# EAGLE schematic Airband (EAGLE 8.6.3)

## Sheet 1 of 7
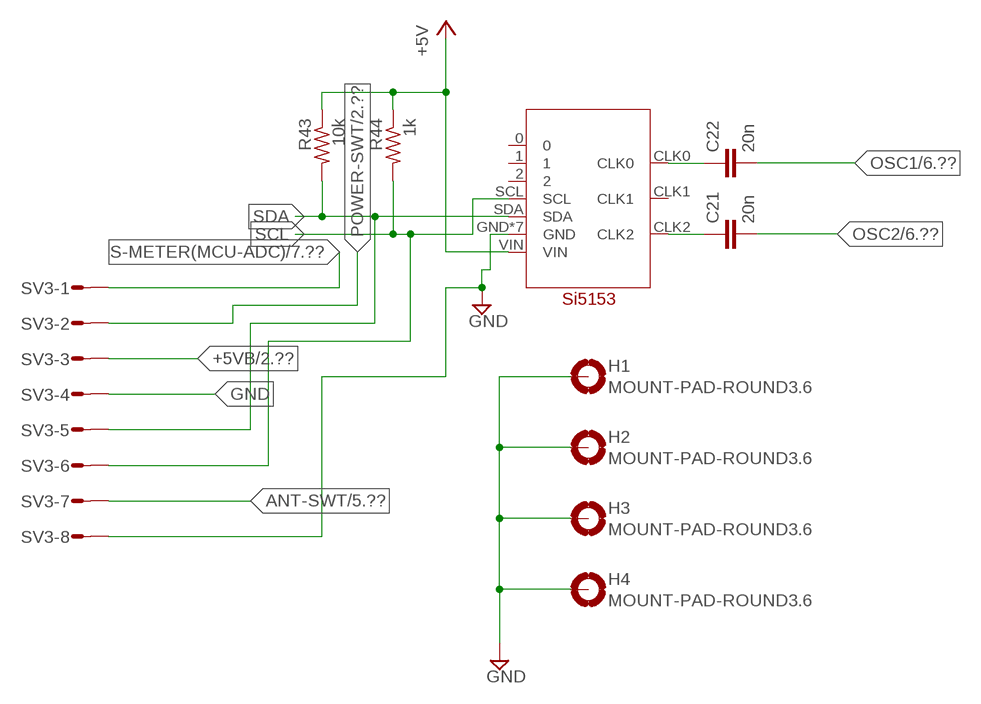
[diagram p0: schematic, sheet 1]

### Parts
C21  20n  C-EUC0805  [C0805]
C22  20n  C-EUC0805  [C0805]
H1  MOUNT-PAD-ROUND3.6  [3,6-PAD]
H2  MOUNT-PAD-ROUND3.6  [3,6-PAD]
H3  MOUNT-PAD-ROUND3.6  [3,6-PAD]
H4  MOUNT-PAD-ROUND3.6  [3,6-PAD]
R43  10k  R-US_R0805  [R0805]
R44  1k  R-US_R0805  [R0805]
SV3  MT6-8  [MT6-8]
U$10  DEVELOPMENT-BOARDS$1_SI5153SI5153  [DEVELOPMENT-BOARDS$1_SI5153]

### Nets
+5VA: R43.1 R44.1 U$10.VIN ; supply symbol labelled +5V ; also sheet 2
+5VB: SV3.3 ; also sheet 2
ANT-SWT: SV3.7 ; also sheet 5
GND: H1.B3,6(MOUNT) H2.B3,6(MOUNT) H3.B3,6(MOUNT) H4.B3,6(MOUNT) SV3.4 SV3.8 U$10.GND U$10.GND00(GND) U$10.GND0(GND) U$10.GND1(GND) U$10.GND2(GND) U$10.GND11(GND) U$10.GND22(GND) ; also sheet 2,3,4,5,6,7
N$38: C21.1 U$10.CLK2
N$39: C22.1 U$10.CLK0
OSC1: C22.2 ; also sheet 6
OSC2: C21.2 ; also sheet 6
POWER-SWT: SV3.2 ; also sheet 2
S-METER(MCU-ADC): SV3.1 ; also sheet 7
SCL: R44.2 SV3.6 U$10.SCL
SDA: R43.2 SV3.5 U$10.SDA
Unconnected: U$10.0 U$10.1 U$10.2 U$10.CLK1

## Sheet 2 of 7
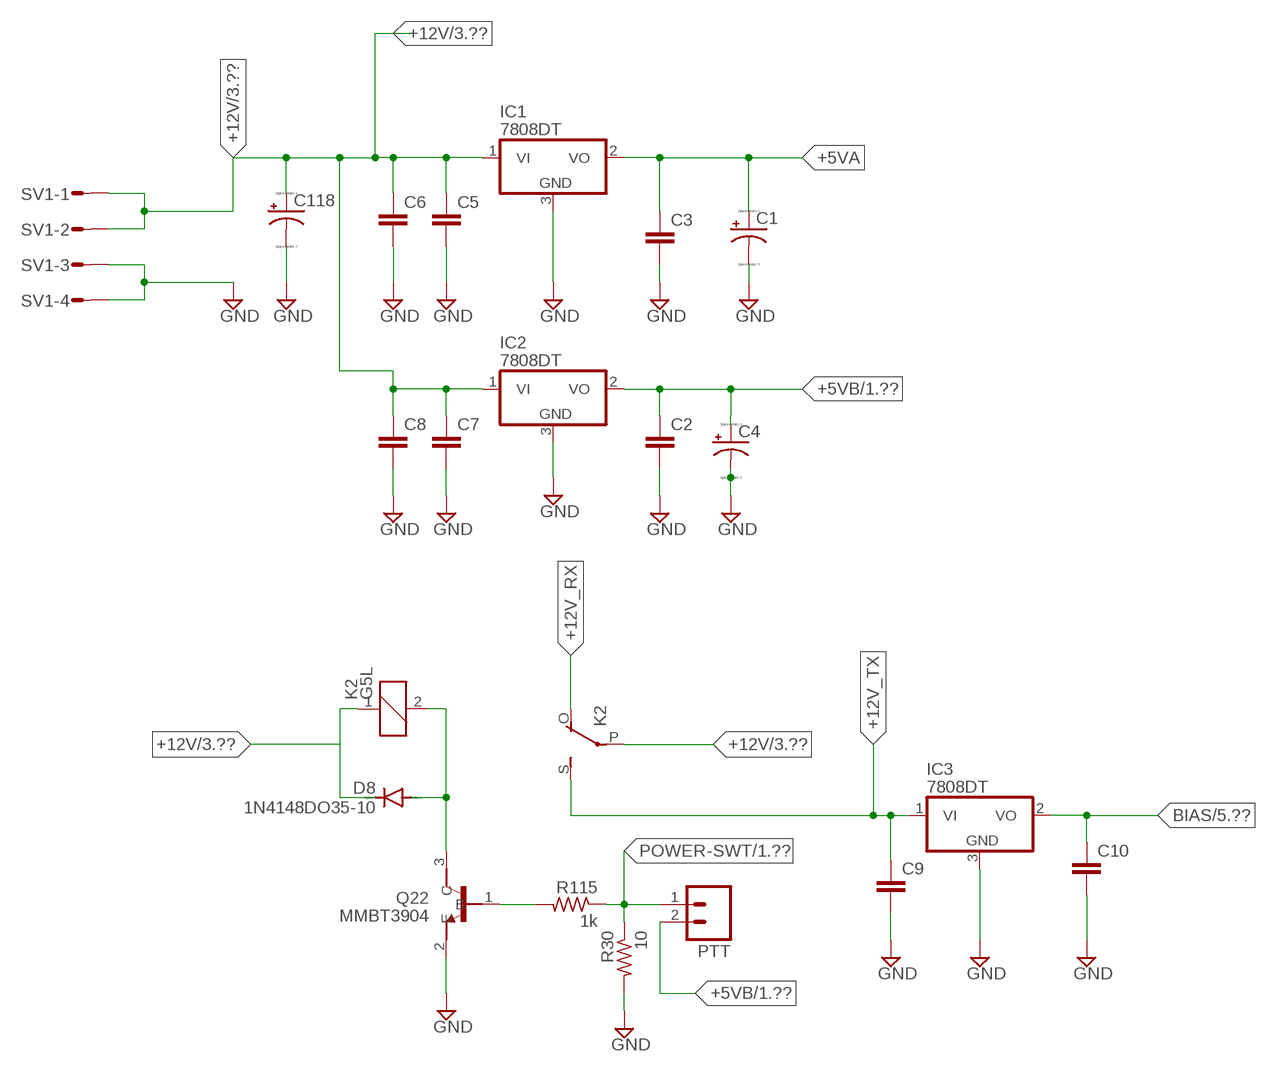
[diagram p1: schematic, sheet 2]

### Parts
C1  CPOL-US153CLV-0405  [153CLV-0405]
C2  C-EUC0805  [C0805]
C3  C-EUC0805  [C0805]
C4  CPOL-US153CLV-0405  [153CLV-0405]
C5  C-EUC0805  [C0805]
C6  C-EUC0805  [C0805]
C7  C-EUC0805  [C0805]
C8  C-EUC0805  [C0805]
C9  C-EUC0805  [C0805]
C10  C-EUC0805  [C0805]
C118  CPOL-US153CLV-0405  [153CLV-0405]
D8  1N4148DO35-10  [DO35-7SMD]
IC1  7808DT  [TO252]
IC2  7808DT  [TO252]
IC3  7808DT  [TO252]
K2  G5L  [G5LE]
PTT  M02  [02P]
Q22  MMBT3904  [SOT95P240X120-3N]
R30  10  R-US_R0805  [R0805]
R115  1k  R-US_R0805  [R0805]
SV1  MT6-4Y  [MT6-4Y]

### Nets
+5VA: C1.+ C3.1 IC1.2(VO) ; also sheet 1
+5VB: C2.1 C4.+ IC2.2(VO) PTT.2 ; also sheet 1
+12V: C5.1 C6.1 C7.1 C8.1 C118.+ D8.C IC1.1(VI) IC2.1(VI) K2.1 K2.P(2:P) SV1.1 SV1.2 ; also sheet 3,5
+12V_RX: K2.O(2:O)
+12V_TX: C9.1 IC3.1(VI) K2.S(2:S)
BIAS: C10.1 IC3.2(VO) ; also sheet 5
GND: C1.- C2.2 C3.2 C4.- C5.2 C6.2 C7.2 C8.2 C9.2 C10.2 C118.- IC1.3(GND) IC2.3(GND) IC3.3(GND) Q22.2(E) R30.2 SV1.3 SV1.4 ; also sheet 1,3,4,5,6,7
N$161: D8.A K2.2 Q22.3(C)
N$162: Q22.1(B) R115.2
POWER-SWT: PTT.1 R30.1 R115.1 ; also sheet 1

## Sheet 3 of 7
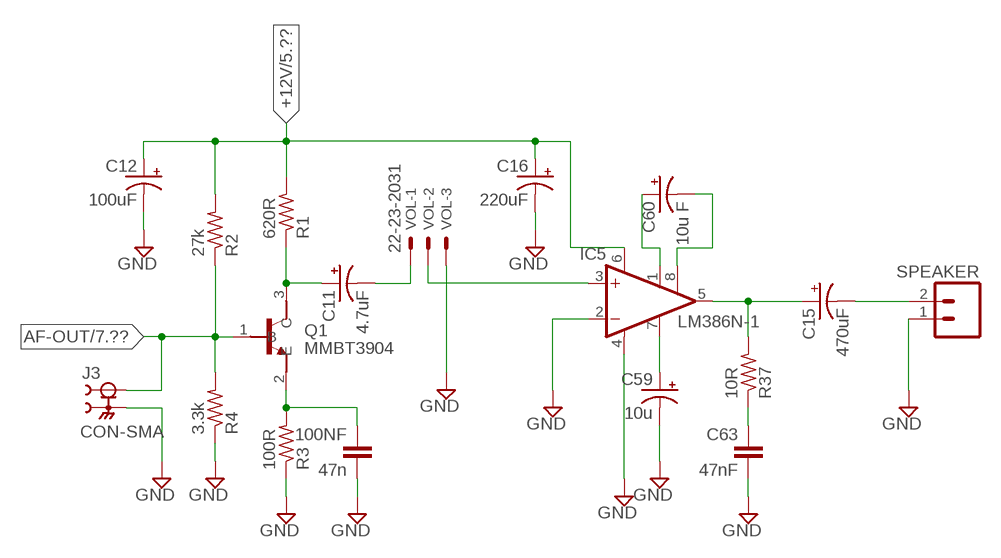
[diagram p2: schematic, sheet 3]

### Parts
100NF  47n  C-EUC0805  [C0805]
C11  4.7uF  CPOL-US153CLV-0405  [153CLV-0405]
C12  100uF  CPOL-US153CLV-0405  [153CLV-0405]
C15  470uF  CPOL-US153CLV-0405  [153CLV-0405]
C16  220uF  CPOL-US153CLV-0405  [153CLV-0405]
C59  10u  CPOL-US153CLV-0405  [153CLV-0405]
C60  10u F  CPOL-US153CLV-0405  [153CLV-0405]
C63  47nF  C-EUC0805  [C0805]
IC5  LM386N-1  [DIL08]
J3  CON-SMA  [CON-SMA-MINI]
Q1  MMBT3904  [SOT95P240X120-3N]
R1  620R  R-US_R0805  [R0805]
R2  27k  R-US_R0805  [R0805]
R3  100R  R-US_R0805  [R0805]
R4  3.3k  R-US_R0805  [R0805]
R37  10R  R-US_R0805  [R0805]
SPEAKER  M02  [02P]
VOL  22-23-2031  [22-23-2031]

### Nets
+12V: C12.+ C16.+ IC5.6(VS) R1.2 R2.2 ; also sheet 2,5
AF-OUT: J3.1 Q1.1(B) R2.1 R4.2 ; also sheet 7
GND: 100NF.2 C12.- C16.- C59.- C63.2 IC5.2(-IN) IC5.4(GND) J3.S1 J3.S2 J3.S3 J3.S4 R3.1 R4.1 SPEAKER.1 VOL.3 ; also sheet 1,2,4,5,6,7
N$1: 100NF.1 Q1.2(E) R3.2
N$6: C11.+ Q1.3(C) R1.1
N$7: C11.- VOL.1
N$8: IC5.3(+IN) VOL.2
N$10: C15.+ IC5.5(OUT) R37.2
N$11: C15.- SPEAKER.2
N$12: C59.+ IC5.7(BYPASS)
N$13: C63.1 R37.1
N$14: C60.+ IC5.1(GAIN)
N$15: C60.- IC5.8(GAIN)

## Sheet 4 of 7
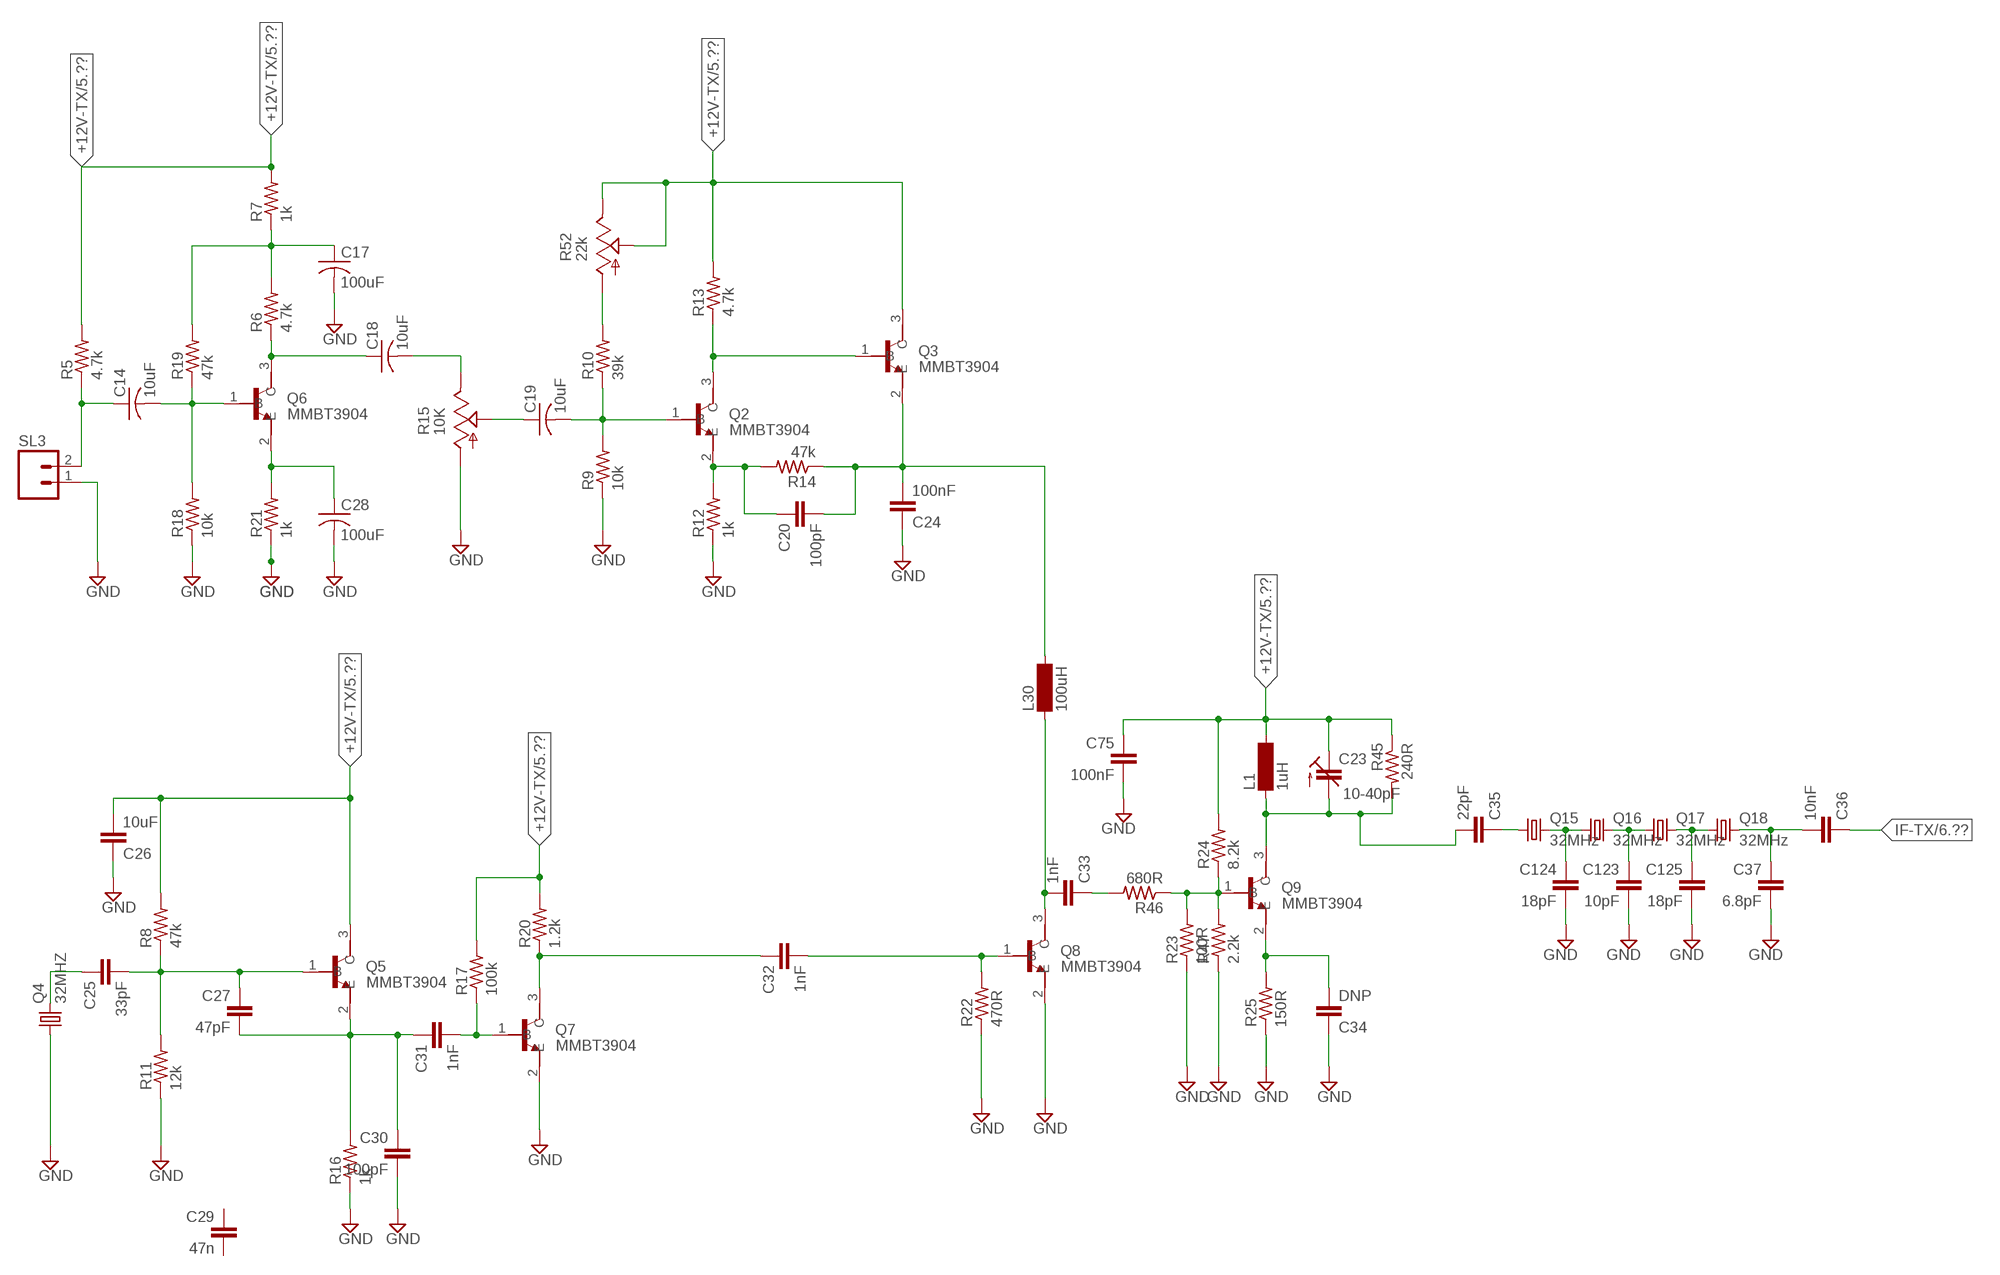
[diagram p3: schematic, sheet 4]

### Parts
C14  10uF  C-USC0805K  [C0805K]
C17  100uF  C-USC0805K  [C0805K]
C18  10uF  C-USC0805K  [C0805K]
C19  10uF  C-USC0805K  [C0805K]
C20  100pF  C-EUC0805  [C0805]
C23  10-40pF  C-TRIMM3008  [CTRIM3008]
C24  100nF  C-EUC0805  [C0805]
C25  33pF  C-EUC0805  [C0805]
C26  10uF  C-EUC0805  [C0805]
C27  47pF  C-EUC0805  [C0805]
C28  100uF  C-USC0805K  [C0805K]
C29  47n  C-EUC0805  [C0805]
C30  100pF  C-EUC0805  [C0805]
C31  1nF  C-EUC0805  [C0805]
C32  1nF  C-EUC0805  [C0805]
C33  1nF  C-EUC0805  [C0805]
C34  DNP  C-EUC0805  [C0805]
C35  22pF  C-EUC0805  [C0805]
C36  10nF  C-EUC0805  [C0805]
C37  6.8pF  C-EUC0805  [C0805]
C75  100nF  C-EUC0805  [C0805]
C123  10pF  C-EUC0805  [C0805]
C124  18pF  C-EUC0805  [C0805]
C125  18pF  C-EUC0805  [C0805]
L1  1uH  SM-Z15  [SM-Z15]
L30  100uH  SM-Z15  [SM-Z15]
Q2  MMBT3904  [SOT95P240X120-3N]
Q3  MMBT3904  [SOT95P240X120-3N]
Q4  32MHZ  CRYSTALHC49S  [HC49/S]
Q5  MMBT3904  [SOT95P240X120-3N]
Q6  MMBT3904  [SOT95P240X120-3N]
Q7  MMBT3904  [SOT95P240X120-3N]
Q8  MMBT3904  [SOT95P240X120-3N]
Q9  MMBT3904  [SOT95P240X120-3N]
Q15  32MHz  CRYSTALHC49S  [HC49/S]
Q16  32MHz  CRYSTALHC49S  [HC49/S]
Q17  32MHz  CRYSTALHC49S  [HC49/S]
Q18  32MHz  CRYSTALHC49S  [HC49/S]
R5  4.7k  R-US_R0805  [R0805]
R6  4.7k  R-US_R0805  [R0805]
R7  1k  R-US_R0805  [R0805]
R8  47k  R-US_R0805  [R0805]
R9  10k  R-US_R0805  [R0805]
R10  39k  R-US_R0805  [R0805]
R11  12k  R-US_R0805  [R0805]
R12  1k  R-US_R0805  [R0805]
R13  4.7k  R-US_R0805  [R0805]
R14  47k  R-US_R0805  [R0805]
R15  10K  TRIM_US-B64Y  [B64Y]
R16  1k  R-US_R0805  [R0805]
R17  100k  R-US_R0805  [R0805]
R18  10k  R-US_R0805  [R0805]
R19  47k  R-US_R0805  [R0805]
R20  1.2k  R-US_R0805  [R0805]
R21  1k  R-US_R0805  [R0805]
R22  470R  R-US_R0805  [R0805]
R23  100R  R-US_R0805  [R0805]
R24  8.2k  R-US_R0805  [R0805]
R25  150R  R-US_R0805  [R0805]
R45  240R  R-US_R0805  [R0805]
R46  680R  R-US_R0805  [R0805]
R47  2.2k  R-US_R0805  [R0805]
R52  22k  TRIM_US-B64Y  [B64Y]
SL3  M02  [02P]

### Nets
+12V-TX: C23.+(E) C26.2 C75.1 L1.2 Q3.3(C) Q5.3(C) R5.2 R7.2 R8.2 R13.2 R17.2 R20.2 R24.2 R45.1 R52.E R52.S ; also sheet 5,6
GND: C17.2 C24.1 C26.1 C28.2 C30.2 C34.1 C37.2 C75.2 C123.2 C124.2 C125.2 Q4.1 Q7.2(E) Q8.2(E) R9.1 R11.1 R12.1 R15.A R16.1 R18.1 R21.1 R22.1 R23.1 R25.1 R47.1 SL3.1 ; also sheet 1,2,3,5,6,7
IF-TX: C36.1 ; also sheet 6
N$2: C23.-(A) C35.2 L1.1 Q9.3(C) R45.2
N$3: C14.1 R5.1 SL3.2
N$4: C17.1 R6.2 R7.1 R19.2
N$5: C18.1 Q6.3(C) R6.1
N$16: C14.2 Q6.1(B) R18.2 R19.1
N$17: C20.1 Q2.2(E) R12.2 R14.2
N$18: C28.1 Q6.2(E) R21.2
N$19: C19.2 Q2.1(B) R9.2 R10.1
N$20: Q2.3(C) Q3.1(B) R13.1
N$21: C20.2 C24.2 L30.2 Q3.2(E) R14.1
N$22: R10.2 R52.A
N$23: C33.1 R46.2
N$24: C35.1 Q15.1
N$25: C25.2 C27.1 Q5.1(B) R8.1 R11.2
N$26: C19.1 R15.S
N$27: C18.2 R15.E
N$28: C32.2 Q8.1(B) R22.2
N$30: C27.2 C30.1 C31.1 Q5.2(E) R16.2
N$31: C25.1 Q4.2
N$32: C31.2 Q7.1(B) R17.1
N$41: C32.1 Q7.3(C) R20.1
N$43: C33.2 L30.1 Q8.3(C)
N$44: Q9.1(B) R23.2 R24.1 R46.1 R47.2
N$45: C34.2 Q9.2(E) R25.2
N$48: C36.2 C37.1 Q18.2
N$141: C124.1 Q15.2 Q16.1
N$146: C123.1 Q16.2 Q17.1
N$147: C125.1 Q17.2 Q18.1
Unconnected: C29.1 C29.2

## Sheet 5 of 7
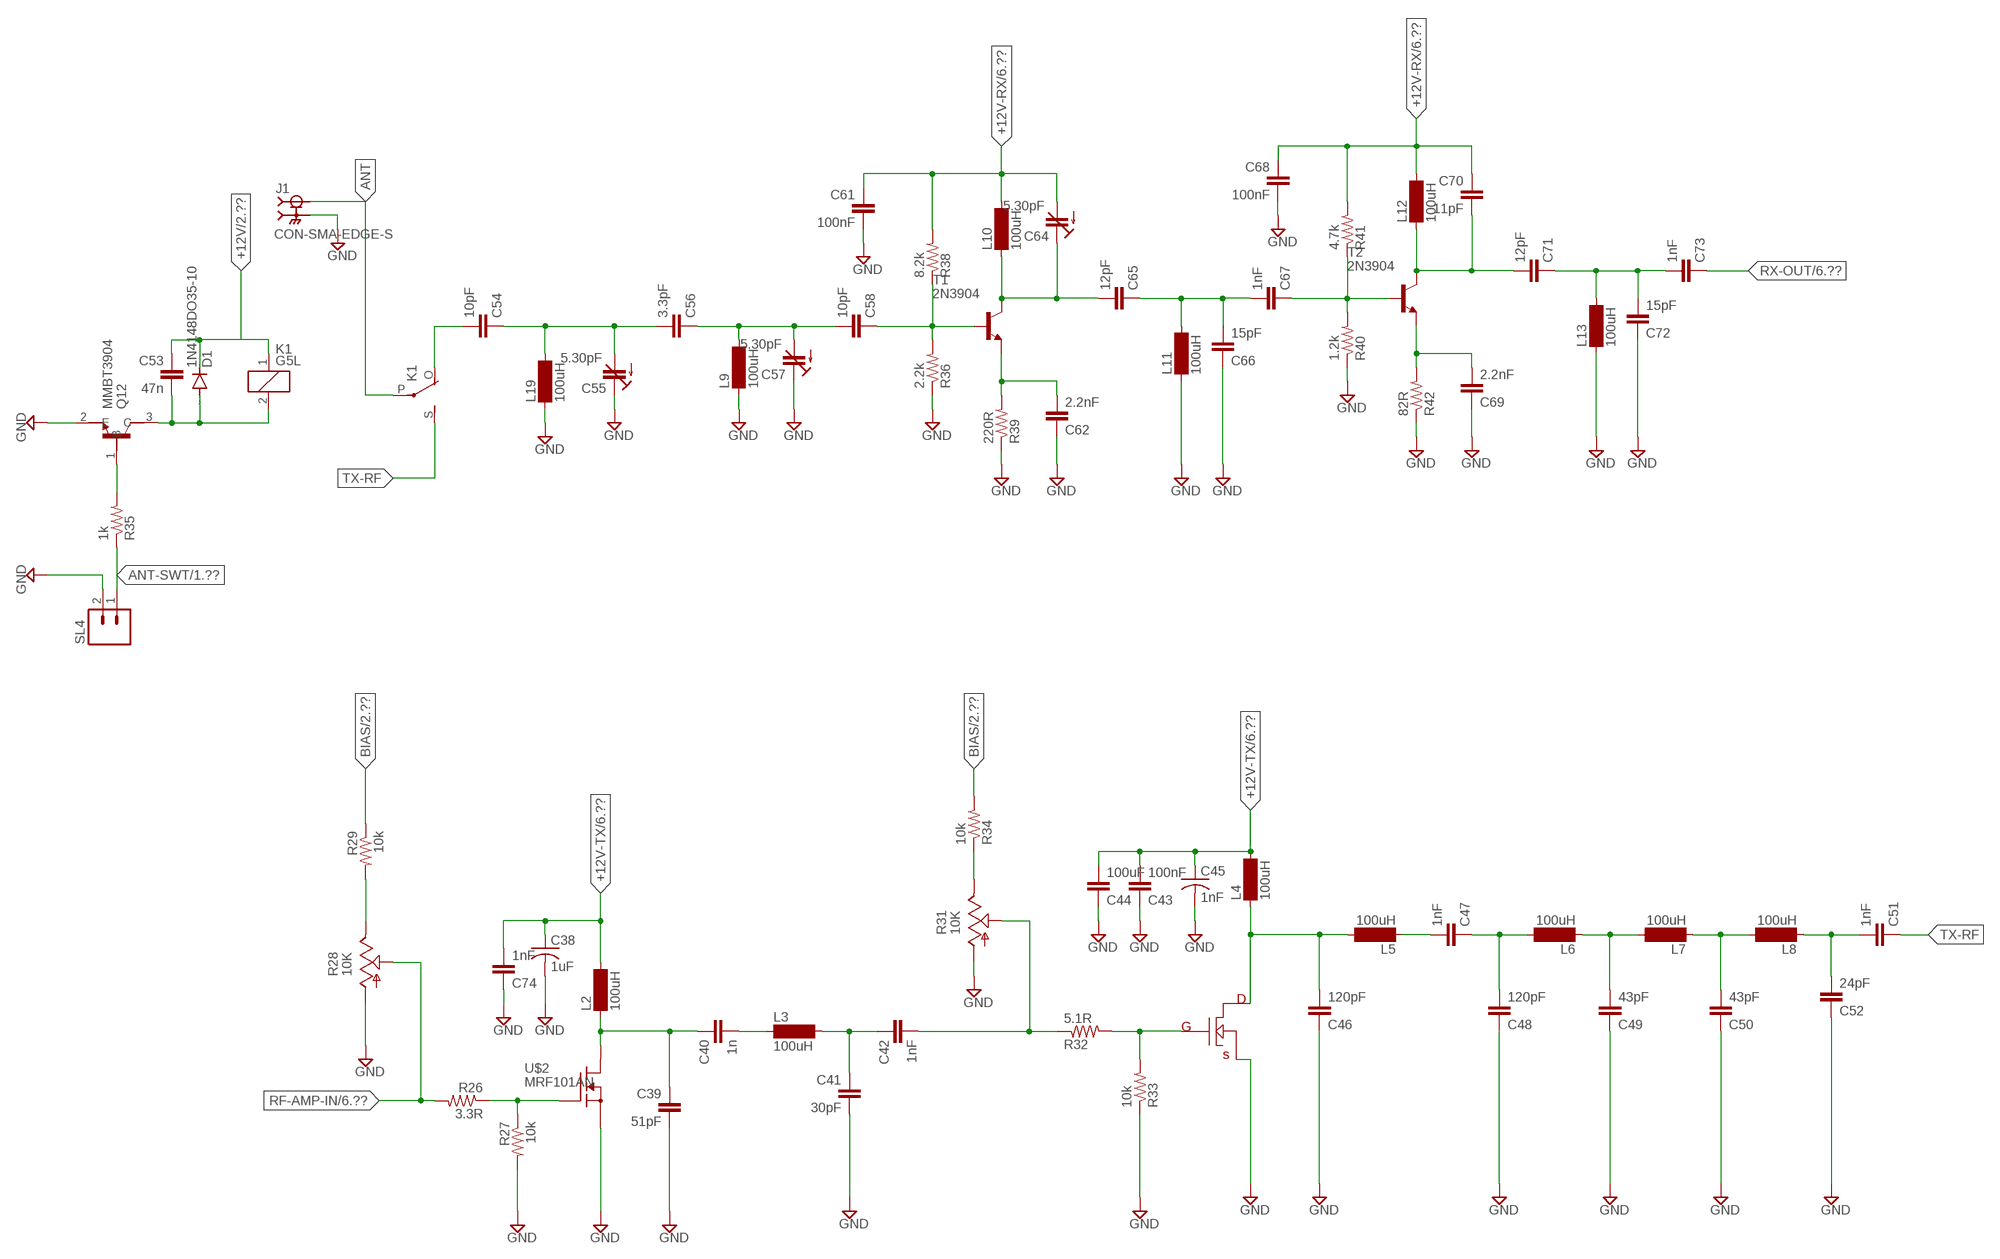
[diagram p4: schematic, sheet 5]

### Parts
C38  1uF  C-USC0805K  [C0805K]
C39  51pF  C-EUC0805  [C0805]
C40  1n  C-EUC0805  [C0805]
C41  30pF  C-EUC0805  [C0805]
C42  1nF  C-EUC0805  [C0805]
C43  100nF  C-EUC0805  [C0805]
C44  100uF  C-EUC0805  [C0805]
C45  1nF  C-USC0805K  [C0805K]
C46  120pF  C-EUC0805  [C0805]
C47  1nF  C-EUC0805  [C0805]
C48  120pF  C-EUC0805  [C0805]
C49  43pF  C-EUC0805  [C0805]
C50  43pF  C-EUC0805  [C0805]
C51  1nF  C-EUC0805  [C0805]
C52  24pF  C-EUC0805  [C0805]
C53  47n  C-EUC0805  [C0805]
C54  10pF  C-EUC0805  [C0805]
C55  5.30pF  C-TRIMM3008  [CTRIM3008]
C56  3.3pF  C-EUC0805  [C0805]
C57  5.30pF  C-TRIMM3008  [CTRIM3008]
C58  10pF  C-EUC0805  [C0805]
C61  100nF  C-EUC0805  [C0805]
C62  2.2nF  C-EUC0805  [C0805]
C64  5.30pF  C-TRIMM3008  [CTRIM3008]
C65  12pF  C-EUC0805  [C0805]
C66  15pF  C-EUC0805  [C0805]
C67  1nF  C-EUC0805  [C0805]
C68  100nF  C-EUC0805  [C0805]
C69  2.2nF  C-EUC0805  [C0805]
C70  11pF  C-EUC0805  [C0805]
C71  12pF  C-EUC0805  [C0805]
C72  15pF  C-EUC0805  [C0805]
C73  1nF  C-EUC0805  [C0805]
C74  1nF  C-EUC0805  [C0805]
D1  1N4148DO35-10  [DO35-7SMD]
J1  CON-SMA-EDGE-S  [RFSOLUTIONS_CON-SMA-EDGE-S]
K1  G5L  [G5LE]
L2  100uH  SM-Z15  [SM-Z15]
L3  100uH  SM-Z15  [SM-Z15]
L4  100uH  SM-Z15  [SM-Z15]
L5  100uH  SM-Z15  [SM-Z15]
L6  100uH  SM-Z15  [SM-Z15]
L7  100uH  SM-Z15  [SM-Z15]
L8  100uH  SM-Z15  [SM-Z15]
L9  100uH  SM-Z15  [SM-Z15]
L10  100uH  SM-Z15  [SM-Z15]
L11  100uH  SM-Z15  [SM-Z15]
L12  100uH  SM-Z15  [SM-Z15]
L13  100uH  SM-Z15  [SM-Z15]
L19  100uH  SM-Z15  [SM-Z15]
Q12  MMBT3904  [SOT95P240X120-3N]
R26  3.3R  R-US_R0805  [R0805]
R27  10k  R-US_R0805  [R0805]
R28  10K  TRIM_US-B64Y  [B64Y]
R29  10k  R-US_R0805  [R0805]
R31  10K  TRIM_US-B64Y  [B64Y]
R32  5.1R  R-US_R0805  [R0805]
R33  10k  R-US_R0805  [R0805]
R34  10k  R-US_R0805  [R0805]
R35  1k  R-US_R0805  [R0805]
R36  2.2k  R-US_R0805  [R0805]
R38  8.2k  R-US_R0805  [R0805]
R39  220R  R-US_R0805  [R0805]
R40  1.2k  R-US_R0805  [R0805]
R41  4.7k  R-US_R0805  [R0805]
R42  82R  R-US_R0805  [R0805]
SL4  M02  [02P]
T1  2N3904  [TO92-EBC(SMD)]
T2  2N3904  [TO92-EBC(SMD)]
U$1  RD04HMS2  [RD07MUS2B]
U$2  MRF101AN  [TO220]

### Nets
+12V: C53.1 D1.C K1.1 ; also sheet 2,3
+12V-RX: C61.1 C64.-(A) C68.1 C70.1 L10.2 L12.2 R38.2 R41.2 ; also sheet 6,7
+12V-TX: C38.1 C43.2 C44.2 C45.1 C74.2 L2.2 L4.2 ; also sheet 4,6
ANT: J1.1 K1.P(2:P)
ANT-SWT: R35.1 SL4.1 ; also sheet 1
BIAS: R29.1 R34.2 ; also sheet 2
GND: C38.2 C39.2 C41.2 C43.1 C44.1 C45.2 C46.1 C48.1 C49.1 C50.1 C52.1 C55.+(E) C57.+(E) C61.2 C62.1 C66.1 C68.2 C69.1 C72.1 C74.1 J1.G1 J1.G2 J1.G3 J1.G4 L9.1 L11.1 L13.1 L19.1 Q12.2(E) R27.2 R28.A R31.A R33.1 R36.1 R39.1 R40.1 R42.1 SL4.2 U$1.S U$2.2(S) ; also sheet 1,2,3,4,6,7
N$9: R28.E R29.2
N$33: R26.1 R27.1 U$2.1(G)
N$35: C39.1 C40.1 L2.1 U$2.3(D)
N$46: C53.2 D1.A K1.2 Q12.3(C)
N$47: C40.2 L3.1
N$50: C41.1 C42.1 L3.2
N$51: C42.2 R31.S R32.1
N$52: R32.2 R33.2 U$1.G
N$53: C46.2 L4.1 L5.2 U$1.D
N$54: Q12.1(B) R35.2
N$55: R31.E R34.1
N$57: C54.2 K1.O(2:O)
N$58: C47.2 L5.1
N$59: C47.1 C48.2 L6.2
N$60: C49.2 L6.1 L7.2
N$61: C50.2 L7.1 L8.2
N$62: C51.2 C52.2 L8.1
N$64: C54.1 C55.-(A) C56.2 L19.2
N$65: C56.1 C57.-(A) C58.2 L9.2
N$66: C58.1 R36.2 R38.1 T1.B
N$67: C62.2 R39.2 T1.E
N$68: C64.+(E) C65.2 L10.1 T1.C
N$69: C67.1 R40.2 R41.1 T2.B
N$70: C65.1 C66.2 C67.2 L11.2
N$71: C69.2 R42.2 T2.E
N$72: C70.2 C71.2 L12.1 T2.C
N$73: C71.1 C72.2 C73.2 L13.2
RF-AMP-IN: R26.2 R28.S ; also sheet 6
RX-OUT: C73.1 ; also sheet 6
TX-RF: C51.1 K1.S(2:S)

## Sheet 6 of 7
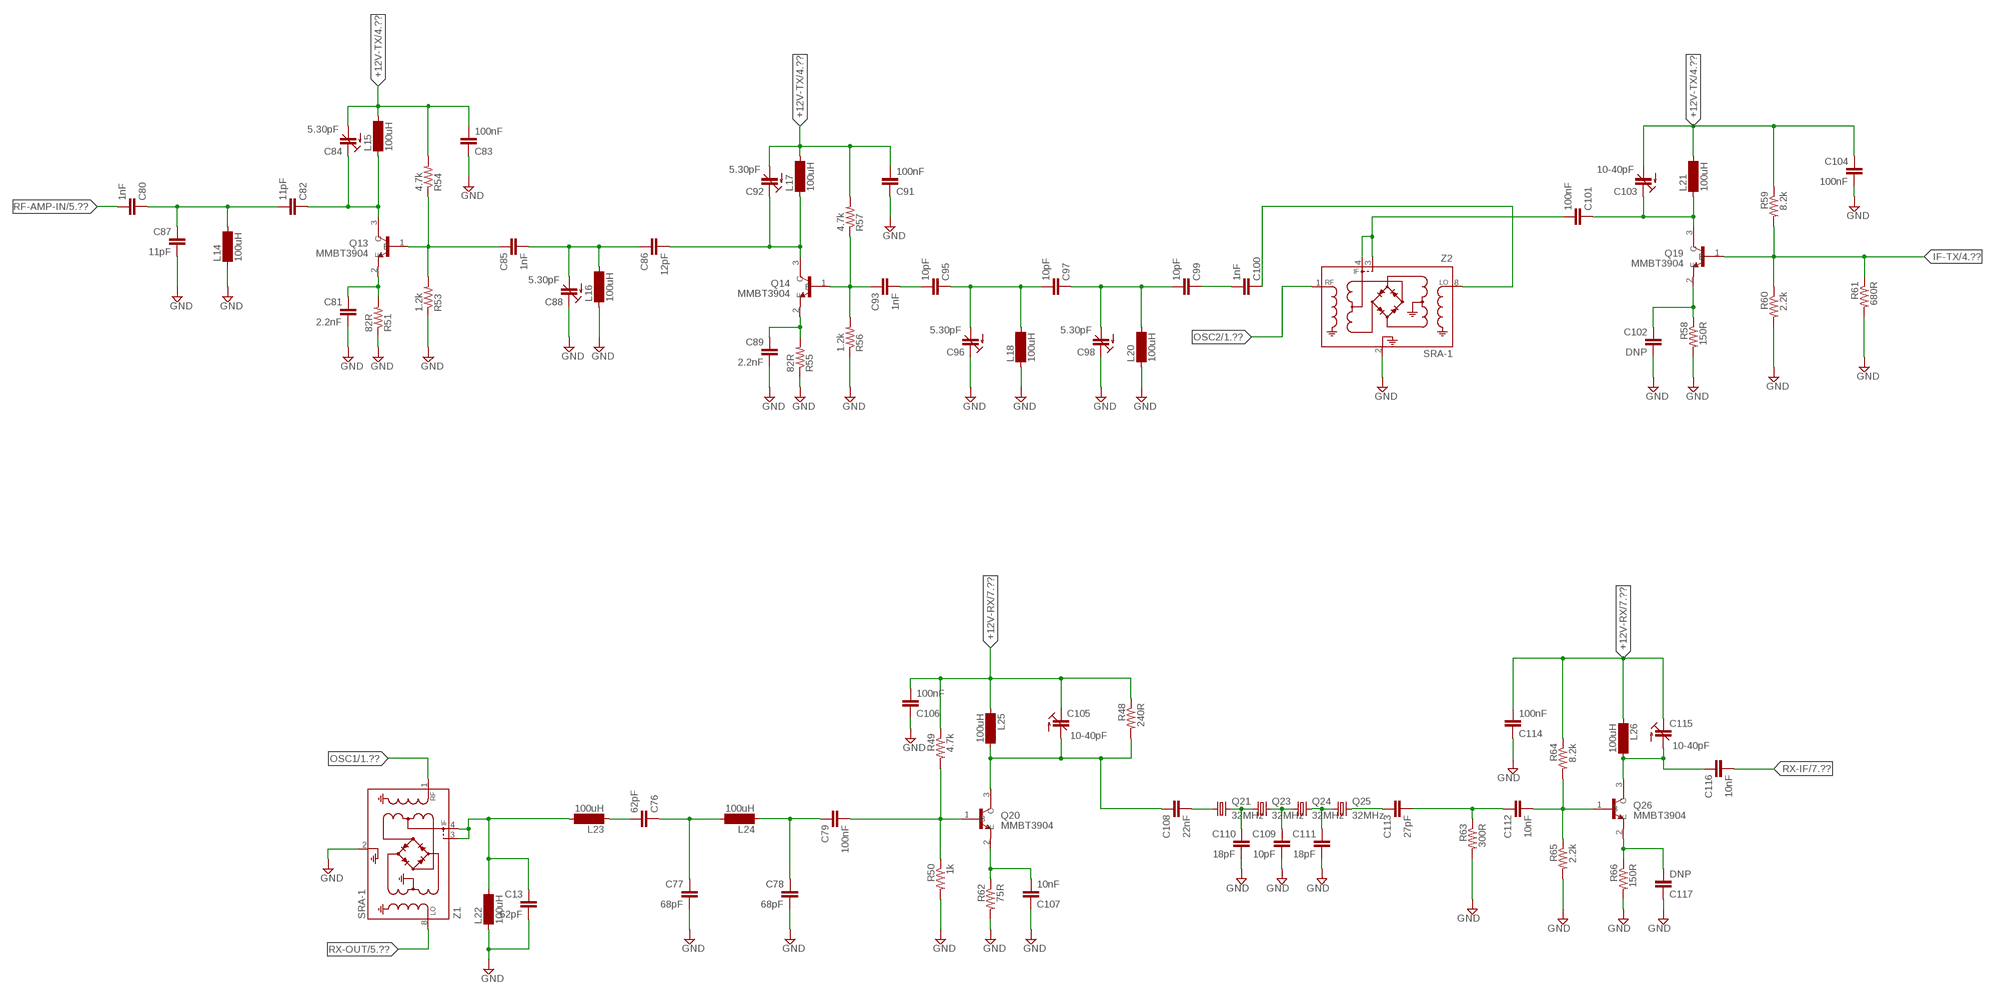
[diagram p5: schematic, sheet 6]

### Parts
C13  62pF  C-EUC0805  [C0805]
C76  62pF  C-EUC0805  [C0805]
C77  68pF  C-EUC0805  [C0805]
C78  68pF  C-EUC0805  [C0805]
C79  100nF  C-EUC0805  [C0805]
C80  1nF  C-EUC0805  [C0805]
C81  2.2nF  C-EUC0805  [C0805]
C82  11pF  C-EUC0805  [C0805]
C83  100nF  C-EUC0805  [C0805]
C84  5.30pF  C-TRIMM3008  [CTRIM3008]
C85  1nF  C-EUC0805  [C0805]
C86  12pF  C-EUC0805  [C0805]
C87  11pF  C-EUC0805  [C0805]
C88  5.30pF  C-TRIMM3008  [CTRIM3008]
C89  2.2nF  C-EUC0805  [C0805]
C91  100nF  C-EUC0805  [C0805]
C92  5.30pF  C-TRIMM3008  [CTRIM3008]
C93  1nF  C-EUC0805  [C0805]
C95  10pF  C-EUC0805  [C0805]
C96  5.30pF  C-TRIMM3008  [CTRIM3008]
C97  10pF  C-EUC0805  [C0805]
C98  5.30pF  C-TRIMM3008  [CTRIM3008]
C99  10pF  C-EUC0805  [C0805]
C100  1nF  C-EUC0805  [C0805]
C101  100nF  C-EUC0805  [C0805]
C102  DNP  C-EUC0805  [C0805]
C103  10-40pF  C-TRIMM3008  [CTRIM3008]
C104  100nF  C-EUC0805  [C0805]
C105  10-40pF  C-TRIMM3008  [CTRIM3008]
C106  100nF  C-EUC0805  [C0805]
C107  10nF  C-EUC0805  [C0805]
C108  22nF  C-EUC0805  [C0805]
C109  10pF  C-EUC0805  [C0805]
C110  18pF  C-EUC0805  [C0805]
C111  18pF  C-EUC0805  [C0805]
C112  10nF  C-EUC0805  [C0805]
C113  27pF  C-EUC0805  [C0805]
C114  100nF  C-EUC0805  [C0805]
C115  10-40pF  C-TRIMM3008  [CTRIM3008]
C116  10nF  C-EUC0805  [C0805]
C117  DNP  C-EUC0805  [C0805]
L14  100uH  SM-Z15  [SM-Z15]
L15  100uH  SM-Z15  [SM-Z15]
L16  100uH  SM-Z15  [SM-Z15]
L17  100uH  SM-Z15  [SM-Z15]
L18  100uH  SM-Z15  [SM-Z15]
L20  100uH  SM-Z15  [SM-Z15]
L21  100uH  SM-Z15  [SM-Z15]
L22  100uH  SM-Z15  [SM-Z15]
L23  100uH  SM-Z15  [SM-Z15]
L24  100uH  SM-Z15  [SM-Z15]
L25  100uH  SM-Z15  [SM-Z15]
L26  100uH  SM-Z15  [SM-Z15]
Q13  MMBT3904  [SOT95P240X120-3N]
Q14  MMBT3904  [SOT95P240X120-3N]
Q19  MMBT3904  [SOT95P240X120-3N]
Q20  MMBT3904  [SOT95P240X120-3N]
Q21  32MHz  CRYSTALHC49S  [HC49/S]
Q23  32MHz  CRYSTALHC49S  [HC49/S]
Q24  32MHz  CRYSTALHC49S  [HC49/S]
Q25  32MHz  CRYSTALHC49S  [HC49/S]
Q26  MMBT3904  [SOT95P240X120-3N]
R48  240R  R-US_R0805  [R0805]
R49  4.7k  R-US_R0805  [R0805]
R50  1k  R-US_R0805  [R0805]
R51  82R  R-US_R0805  [R0805]
R53  1.2k  R-US_R0805  [R0805]
R54  4.7k  R-US_R0805  [R0805]
R55  82R  R-US_R0805  [R0805]
R56  1.2k  R-US_R0805  [R0805]
R57  4.7k  R-US_R0805  [R0805]
R58  150R  R-US_R0805  [R0805]
R59  8.2k  R-US_R0805  [R0805]
R60  2.2k  R-US_R0805  [R0805]
R61  680R  R-US_R0805  [R0805]
R62  75R  R-US_R0805  [R0805]
R63  300R  R-US_R0805  [R0805]
R64  8.2k  R-US_R0805  [R0805]
R65  2.2k  R-US_R0805  [R0805]
R66  150R  R-US_R0805  [R0805]
Z1  SRA-1  [A01]
Z2  SRA-1  [A01]

### Nets
+12V-RX: C105.+(E) C106.2 C114.2 C115.+(E) L25.1 L26.1 R48.1 R49.1 R64.1 ; also sheet 5,7
+12V-TX: C83.2 C84.-(A) C91.2 C92.-(A) C103.-(A) C104.1 L15.2 L17.2 L21.2 R54.2 R57.2 R59.1 ; also sheet 4,5
GND: C13.2 C77.2 C78.2 C81.2 C83.1 C87.2 C88.+(E) C89.2 C91.1 C96.+(E) C98.+(E) C102.2 C104.2 C106.1 C107.1 C109.2 C110.2 C111.2 C114.1 C117.1 L14.1 L16.1 L18.1 L20.1 L22.1 R50.2 R51.1 R53.1 R55.1 R56.1 R58.2 R60.2 R61.2 R62.2 R63.2 R65.2 R66.2 Z1.2(CASEGROUND) Z2.2(CASEGROUND) ; also sheet 1,2,3,4,5,7
IF-TX: Q19.1(B) R59.2 R60.1 R61.1 ; also sheet 4
N$29: C76.2 L23.1
N$34: C76.1 C77.1 L24.2
N$36: C78.1 C79.1 L24.1
N$37: C100.1 Z2.8(L)
N$40: C82.1 C84.+(E) L15.1 Q13.3(C)
N$63: C85.1 Q13.1(B) R53.2 R54.1
N$74: C85.2 C86.1 C88.-(A) L16.2
N$75: C80.1 C82.2 C87.1 L14.2
N$76: C81.1 Q13.2(E) R51.2
N$78: C86.2 C92.+(E) L17.1 Q14.3(C)
N$79: C93.1 Q14.1(B) R56.2 R57.1
N$80: C93.2 C95.2
N$82: C89.1 Q14.2(E) R55.2
N$83: C95.1 C96.-(A) C97.2 L18.2
N$84: C97.1 C98.-(A) C99.2 L20.2
N$85: C99.1 C100.2
N$86: C101.1 C103.+(E) L21.1 Q19.3(C)
N$87: C102.1 Q19.2(E) R58.1
N$90: C79.2 Q20.1(B) R49.2 R50.1
N$91: C107.2 Q20.2(E) R62.1
N$92: C105.-(A) C108.1 L25.2 Q20.3(C) R48.2
N$94: C110.1 Q21.2 Q23.1
N$95: C109.1 Q23.2 Q24.1
N$96: C111.1 Q24.2 Q25.1
N$97: C108.2 Q21.1
N$98: C112.1 C113.2 R63.1
N$99: C113.1 Q25.2
N$100: C112.2 Q26.1(B) R64.2 R65.1
N$101: C117.2 Q26.2(E) R66.1
N$102: C115.-(A) C116.1 L26.2 Q26.3(C)
N$105: C101.2 Z2.3(IF) Z2.4(IF)
N$107: C13.1 L22.2 L23.2 Z1.3(IF) Z1.4(IF)
OSC1: Z1.1(R) ; also sheet 1
OSC2: Z2.1(R) ; also sheet 1
RF-AMP-IN: C80.2 ; also sheet 5
RX-IF: C116.2 ; also sheet 7
RX-OUT: Z1.8(L) ; also sheet 5

## Sheet 7 of 7
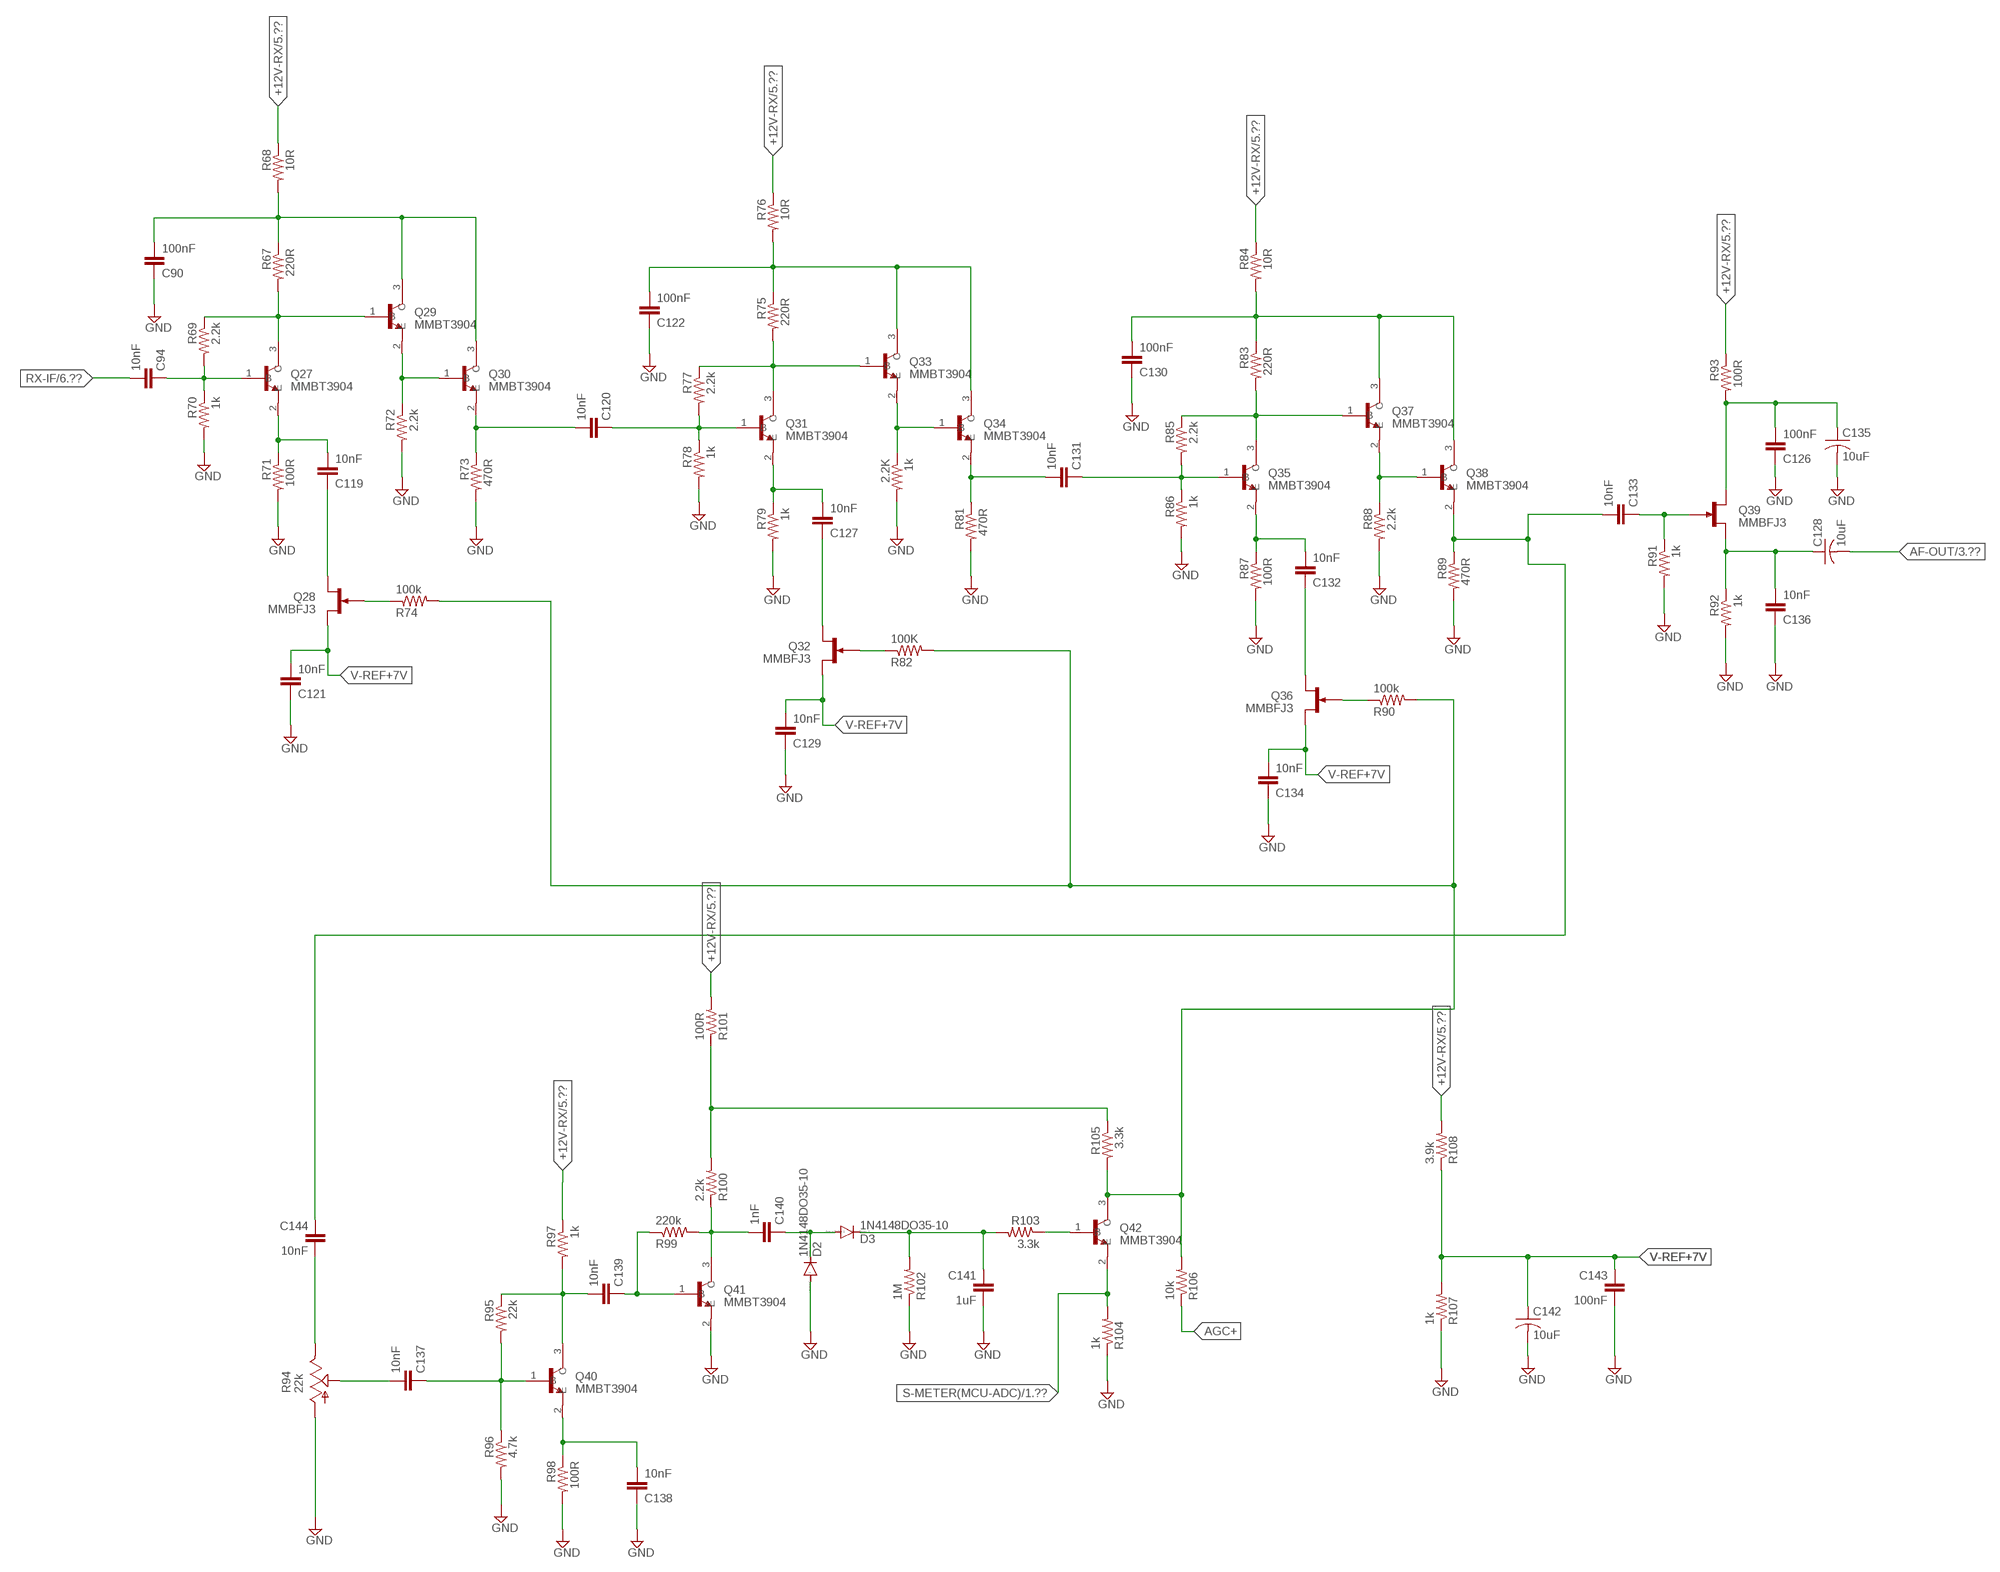
[diagram p6: schematic, sheet 7]

### Parts
2.2K  1k  R-US_R0805  [R0805]
C90  100nF  C-EUC0805  [C0805]
C94  10nF  C-EUC0805  [C0805]
C119  10nF  C-EUC0805  [C0805]
C120  10nF  C-EUC0805  [C0805]
C121  10nF  C-EUC0805  [C0805]
C122  100nF  C-EUC0805  [C0805]
C126  100nF  C-EUC0805  [C0805]
C127  10nF  C-EUC0805  [C0805]
C128  10uF  C-USC0805K  [C0805K]
C129  10nF  C-EUC0805  [C0805]
C130  100nF  C-EUC0805  [C0805]
C131  10nF  C-EUC0805  [C0805]
C132  10nF  C-EUC0805  [C0805]
C133  10nF  C-EUC0805  [C0805]
C134  10nF  C-EUC0805  [C0805]
C135  10uF  C-USC0805K  [C0805K]
C136  10nF  C-EUC0805  [C0805]
C137  10nF  C-EUC0805  [C0805]
C138  10nF  C-EUC0805  [C0805]
C139  10nF  C-EUC0805  [C0805]
C140  1nF  C-EUC0805  [C0805]
C141  1uF  C-EUC0805  [C0805]
C142  10uF  C-USC0805K  [C0805K]
C143  100nF  C-EUC0805  [C0805]
C144  10nF  C-EUC0805  [C0805]
D2  1N4148DO35-10  [DO35-7SMD]
D3  1N4148DO35-10  [DO35-7SMD]
Q27  MMBT3904  [SOT95P240X120-3N]
Q28  MMBFJ3  [SOT23]
Q29  MMBT3904  [SOT95P240X120-3N]
Q30  MMBT3904  [SOT95P240X120-3N]
Q31  MMBT3904  [SOT95P240X120-3N]
Q32  MMBFJ3  [SOT23]
Q33  MMBT3904  [SOT95P240X120-3N]
Q34  MMBT3904  [SOT95P240X120-3N]
Q35  MMBT3904  [SOT95P240X120-3N]
Q36  MMBFJ3  [SOT23]
Q37  MMBT3904  [SOT95P240X120-3N]
Q38  MMBT3904  [SOT95P240X120-3N]
Q39  MMBFJ3  [SOT23]
Q40  MMBT3904  [SOT95P240X120-3N]
Q41  MMBT3904  [SOT95P240X120-3N]
Q42  MMBT3904  [SOT95P240X120-3N]
R67  220R  R-US_R0805  [R0805]
R68  10R  R-US_R0805  [R0805]
R69  2.2k  R-US_R0805  [R0805]
R70  1k  R-US_R0805  [R0805]
R71  100R  R-US_R0805  [R0805]
R72  2.2k  R-US_R0805  [R0805]
R73  470R  R-US_R0805  [R0805]
R74  100k  R-US_R0805  [R0805]
R75  220R  R-US_R0805  [R0805]
R76  10R  R-US_R0805  [R0805]
R77  2.2k  R-US_R0805  [R0805]
R78  1k  R-US_R0805  [R0805]
R79  1k  R-US_R0805  [R0805]
R81  470R  R-US_R0805  [R0805]
R82  100K  R-US_R0805  [R0805]
R83  220R  R-US_R0805  [R0805]
R84  10R  R-US_R0805  [R0805]
R85  2.2k  R-US_R0805  [R0805]
R86  1k  R-US_R0805  [R0805]
R87  100R  R-US_R0805  [R0805]
R88  2.2k  R-US_R0805  [R0805]
R89  470R  R-US_R0805  [R0805]
R90  100k  R-US_R0805  [R0805]
R91  1k  R-US_R0805  [R0805]
R92  1k  R-US_R0805  [R0805]
R93  100R  R-US_R0805  [R0805]
R94  22k  TRIM_US-B64Y  [B64Y]
R95  22k  R-US_R0805  [R0805]
R96  4.7k  R-US_R0805  [R0805]
R97  1k  R-US_R0805  [R0805]
R98  100R  R-US_R0805  [R0805]
R99  220k  R-US_R0805  [R0805]
R100  2.2k  R-US_R0805  [R0805]
R101  100R  R-US_R0805  [R0805]
R102  1M  R-US_R0805  [R0805]
R103  3.3k  R-US_R0805  [R0805]
R104  1k  R-US_R0805  [R0805]
R105  3.3k  R-US_R0805  [R0805]
R106  10k  R-US_R0805  [R0805]
R107  1k  R-US_R0805  [R0805]
R108  3.9k  R-US_R0805  [R0805]

### Nets
+12V-RX: R68.1 R76.1 R84.1 R93.1 R97.1 R101.2 R108.2 ; also sheet 5,6
AF-OUT: C128.2 ; also sheet 3
AGC+: R106.1
GND: 2.2K.2 C90.1 C121.1 C122.1 C126.1 C129.1 C130.1 C134.1 C135.2 C136.1 C138.1 C141.2 C142.2 C143.2 D2.A Q41.2(E) R70.2 R71.2 R72.2 R73.2 R78.2 R79.2 R81.2 R86.2 R87.2 R88.2 R89.2 R91.2 R92.2 R94.A R96.2 R98.2 R102.1 R104.1 R107.1 ; also sheet 1,2,3,4,5,6
N$42: C94.1 Q27.1(B) R69.2 R70.1
N$77: C119.2 Q27.2(E) R71.1
N$81: C119.1 Q28.1(D)
N$89: Q28.3(G) R74.1
N$93: Q27.3(C) Q29.1(B) R67.2 R69.1
N$103: C90.2 Q29.3(C) Q30.3(C) R67.1 R68.2
N$104: Q29.2(E) Q30.1(B) R72.1
N$106: C120.2 Q30.2(E) R73.1
N$108: C120.1 Q31.1(B) R77.2 R78.1
N$109: C127.2 Q31.2(E) R79.1
N$110: C127.1 Q32.1(D)
N$112: Q32.3(G) R82.1
N$113: Q31.3(C) Q33.1(B) R75.2 R77.1
N$114: C122.2 Q33.3(C) Q34.3(C) R75.1 R76.2
N$115: 2.2K.1 Q33.2(E) Q34.1(B)
N$116: C131.2 Q34.2(E) R81.1
N$117: C131.1 Q35.1(B) R85.2 R86.1
N$118: C132.2 Q35.2(E) R87.1
N$119: C132.1 Q36.1(D)
N$121: Q36.3(G) R90.1
N$122: Q35.3(C) Q37.1(B) R83.2 R85.1
N$123: C130.2 Q37.3(C) Q38.3(C) R83.1 R84.2
N$124: Q37.2(E) Q38.1(B) R88.1
N$125: C133.2 C144.1 Q38.2(E) R89.1
N$126: Q42.3(C) R74.2 R82.2 R90.2 R105.2 R106.2
N$128: C128.1 C136.2 Q39.2(S) R92.1
N$129: C133.1 Q39.3(G) R91.1
N$130: C126.2 C135.1 Q39.1(D) R93.2
N$132: C144.2 R94.E
N$135: Q42.1(B) R103.1
N$137: C141.1 D3.C R102.2 R103.2
N$138: C140.1 D2.C D3.A
N$139: C140.2 Q41.3(C) R99.2 R100.1
N$140: C139.1 Q41.1(B) R99.1
N$142: C139.2 Q40.3(C) R95.1 R97.2
N$143: C137.2 R94.S
N$144: C137.1 Q40.1(B) R95.2 R96.1
N$145: C138.2 Q40.2(E) R98.1
N$149: R100.2 R101.1 R105.1
RX-IF: C94.2 ; also sheet 6
S-METER(MCU-ADC): Q42.2(E) R104.2 ; also sheet 1
V-REF+7V: C121.2 C129.2 C134.2 C142.1 C143.1 Q28.2(S) Q32.2(S) Q36.2(S) R107.2 R108.1

## Power pins joined to a net without a drawn wire
GND: Z1.5(GND) Z1.6(GND) Z1.7(GND) Z2.5(GND) Z2.6(GND) Z2.7(GND)

## Library data of the parts
2.2K R1-R14 R16-R27 R29 R30 R32-R51 R53-R79 R81-R93 R95-R108 R115 = rcl:R-US_: RESISTOR, American symbol; SPICEPREFIX: R
100NF C13 C20-C22 C24-C27 C29-C37 C39-C44 C46-C54 C56 C58 C61-C63 C65-C83 C85-C87 C89-C91 C93-C95 C97 C99-C102 C104 C106-C114 C116 C117 C119-C127 C129-C134 C136-C141 C143 C144 = resistor:C-EU: CAPACITOR, European symbol
C1 C4 C118 = resistor:CPOL-US: POLARIZED CAPACITOR, American symbol
C2 C3 C5-C10 = rcl:C-EU: CAPACITOR, European symbol; SPICEPREFIX: C
C11 C12 C15 C16 C59 C60 = rcl:CPOL-US: POLARIZED CAPACITOR, American symbol; SPICEPREFIX: C
C14 C17-C19 C28 C38 C45 C128 C135 C142 = rcl:C-US: CAPACITOR, American symbol; SPICEPREFIX: C
C23 C55 C57 C64 C84 C88 C92 C96 C98 C103 C105 C115 = rcl:C-TRIMM: Trimm capacitor; SPICEPREFIX: C
D1-D3 D8 = HFR:1N4148: DIODE high speed (Philips)
H1-H4 = holes:MOUNT-PAD-ROUND: MOUNTING PAD, round
IC1-IC3 = linear:78*: Positive VOLTAGE REGULATOR Source: http://cache.national.com/ds/LM/LM78L05.pdf http://www.fairchildsemi.com/ds/LM/LM7805.pdf
IC5 = linear:LM386?-*: Low Voltage Audio Power Amplifier Source: http://cache.national.com/ds/LM/LM386.pdf
J1 = CON-SMA-EDGE-S:CON-SMA-EDGE-S: Check availability; AVAILABILITY: In Stock; DESCRIPTION: SMA Connector Jack, Female Socket - Board Edge, End Launch Solder; MF: RF Solutions; MP: CON-SMA-EDGE-S; PACKAGE: None; PRICE: None; PURCHASE-URL: https://pricing.snapeda.com/search/part/CON-SMA-EDGE-S/?ref=eda
J3 = HFR:CON-SMA: SMA FEMALE PCB MOUNT
K1 K2 = relay:G5L: RELAY 1 x switch, 10 A/120 V AC, 8 A/30 V ADC, Omron; OC_FARNELL: unknown; OC_NEWARK: unknown
L1-L26 L30 = inductor-neosid:SM-Z15: INDUCTOR SMD rod core choke; OC_FARNELL: unknown; OC_NEWARK: unknown
PTT SL3 SL4 SPEAKER = con-amp-quick:M02: AMP QUICK CONNECTOR; OC_FARNELL: unknown; OC_NEWARK: unknown
Q1-Q3 Q5-Q9 Q12-Q14 Q19 Q20 Q22 Q26 Q27 Q29-Q31 Q33-Q35 Q37 Q38 Q40-Q42 = SnapEDA Library:MMBT3904: MMBT3904 Series 40 V CE Breakdown 0.2 A NPN General Purpose Amplifier - SOT-23; MANUFACTURER: Fairchild Semiconductor
Q4 Q15-Q18 Q21 Q23-Q25 = crystal:CRYSTAL: CRYSTAL; OC_FARNELL: 1667008; OC_NEWARK: unknown
Q28 Q32 Q36 Q39 = transistor-small-signal:MMBFJ3*: N-Channel RF Amplifier Source: http://www.fairchildsemi.com/pf/J3/J310.html
R15 R28 R31 R52 R94 = HFR:TRIM_US-: POTENTIOMETER
SV1 = con-amp-mt6:MT6-4Y: AMP MT6 CONNECTOR; OC_FARNELL: unknown; OC_NEWARK: unknown
SV3 = con-amp-mt6:MT6-8: AMP MT6 CONNECTOR; OC_FARNELL: unknown; OC_NEWARK: unknown
T1 T2 = HFR:2N3904: NPN TRANSISTOR
U$1 = RD04HMS2:RD04HMS2: RD04HMS2
U$2 = MRF101AN:MRF101AN: MRF101AN
U$10 = Radio111 lib:DEVELOPMENT-BOARDS$1_SI5153: SI5153 8KHz - 160MHz OSCILLATOR
VOL = con-molex:22-23-2031: .100" (2.54mm) Center Header - 3 Pin; MF: MOLEX; MPN: 22-23-2031; OC_FARNELL: 1462950; OC_NEWARK: 30C0862
Z1 Z2 = minicircuits:SRA-1: Frequency Mixer Level 7 (LO Power + 7 dBm) Source: minicircuits.com .. SRA-1+.pdf; OC_FARNELL: unknown; OC_NEWARK: unknown